# Altium schematic sheet Node_lora_schemetic (1).SchDoc
size 594 x 420 mm; SheetNumber: 1; SheetTotal: 1
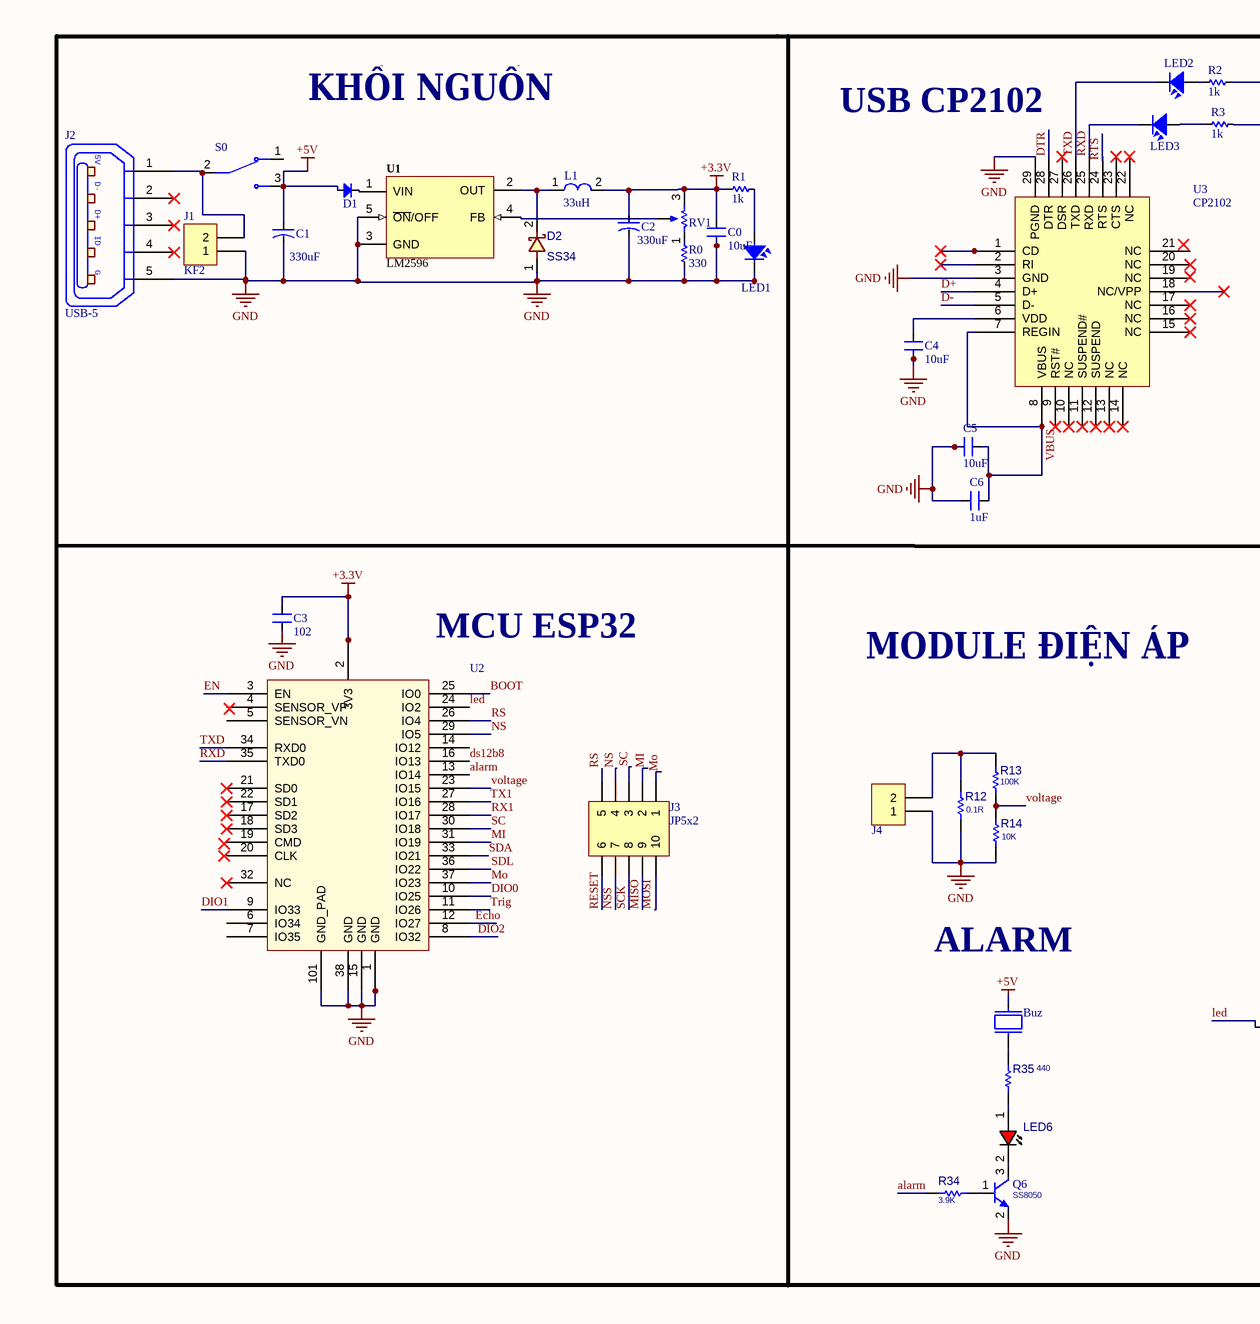
[diagram p0: Node_lora_schemetic (1).SchDoc, left]
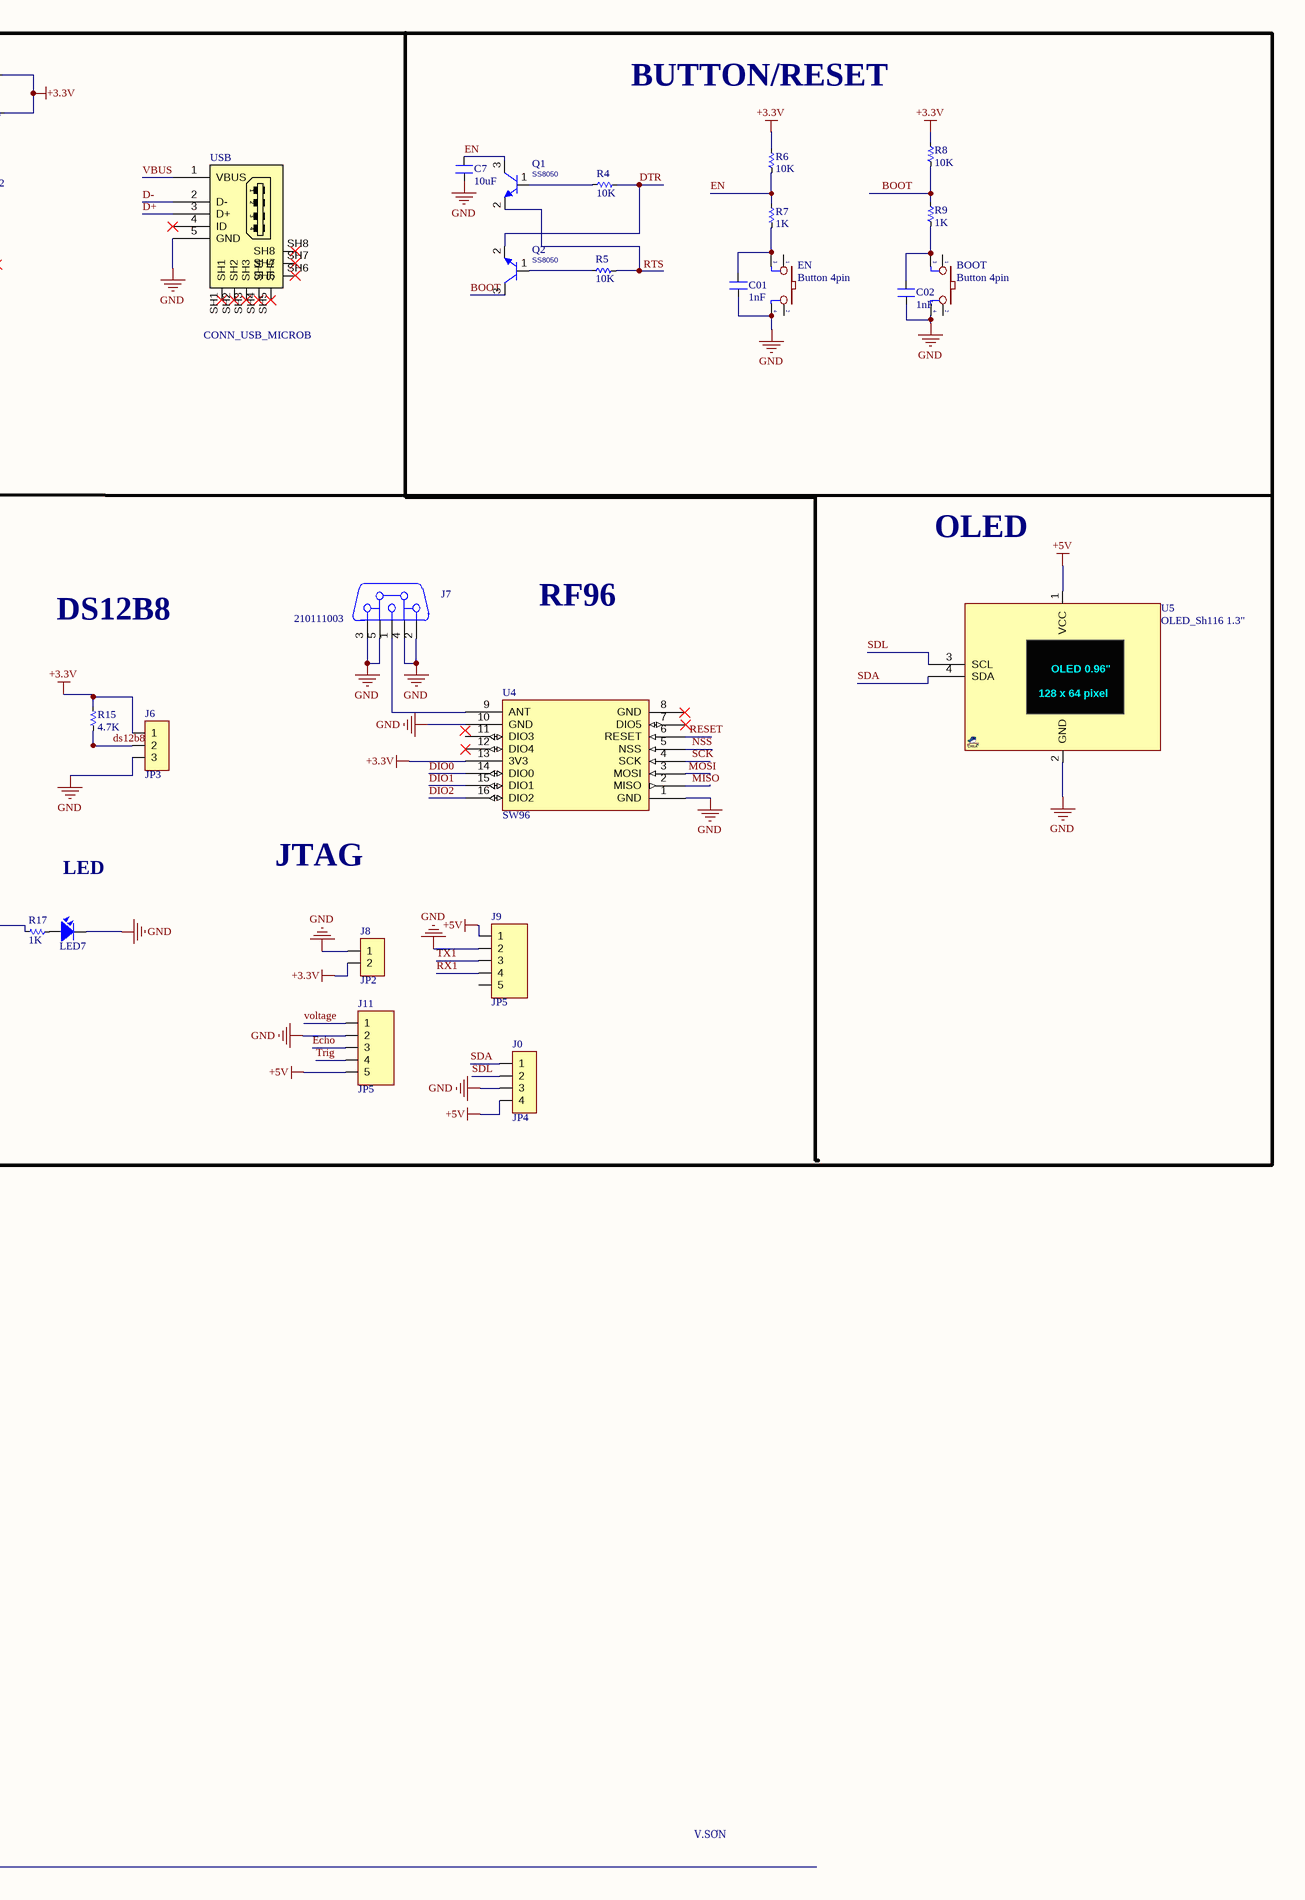
[diagram p1: Node_lora_schemetic (1).SchDoc, right]

## Parts
BOOT  Button 4pin  [Button 4pin]
Buz  PS1240P02BT  [XDCR_PS1240P02BT]  (value not drawn)
C0  10uF  [SM-0805]
C1  330uF  [CAP-ALU-SMD-G]
C01  1nF  [SM-0805]
C2  330uF  [CAP-ALU-SMD-G]
C02  1nF  [SM-0805]
C3  102  [SM-0805]
C4  10uF  [SM-0805]
C5  10uF  [SM-0805]
C6  1uF  [SM-0805]
C7  10uF  [SM-0805]
D1  Diode SMD  [DIO-SMD-106]  (value not drawn)
D2  SS34  [D_SMA]
EN  Button 4pin  [Button 4pin]
J0  JP4  [JP4-C1T]
J1  KF2  [KF2-3.5]
J2  USB-5  [USB-M1]
J3  JP5x2  [JP5-D2T]
J4  KF2  [KF2-3.5]  (value not drawn)
J6  JP3  [JP3-C1T]
J7  210111003  [SMA-RA]
J8  JP2  [JP2-C1T]
J9  JP5  [JP5-C1T]
J11  JP5  [JP5-C1T]
L1  33uH  [L-SMD-M-12x10]
LED1  LED  [LED-0805-Red]  (value not drawn)
LED2  LED  [LED-0805-Red]  (value not drawn)
LED3  LED  [LED-0805-Red]  (value not drawn)
LED6  LED5MM_RED  [LED5MM_RED]  (value not drawn)
LED7  LED  [LED-0805-Red]  (value not drawn)
Q1  SS8050  [SOT23_3]
Q2  SS8050  [SOT23_3]
Q6  SS8050  [SOT23_3]
R0  330  [RES-SMD-0805]
R1  1k  [RES-SMD-0805]
R2  1k  [RES-SMD-0805]
R3  1k  [RES-SMD-0805]
R4  10K  [RES-SMD-0805]
R5  10K  [RES-SMD-0805]
R6  10K  [RES-SMD-0805]
R7  1K  [RES-SMD-0805]
R8  10K  [RES-SMD-0805]
R9  1K  [RES-SMD-0805]
R12  0.1R  [RES-SMD-1206]
R13  100K  [R0805]
R14  10K  [R0805]
R15  4.7K  [RES-SMD-0805]
R17  1K  [RES-SMD-0805]
R34  3.9K  [R0805]
R35  440  [R0805]
RV1  RV20K  [RVAR10K]  (value not drawn)
S0  500SSP1S2M2QEA  [SW_500SSP1S2M2QEA]  (value not drawn)
U1  LM2596  [TO263]
U2  ESP32S_Module  [ESP32S]  (value not drawn)
U3  CP2102  [QFN50P500X500X100-29N]
U4  SW96  [RFM22_S]
U5  OLED_Sh116 1.3"  [OLED_SSD1306_64_I2C]
USB  CONN_USB_MICROB  [USB_MICRO_B_BM_SHS]

## Nets
+3.3V: C0.1 C2.1 C3.1 J6.1 J8.2 L1.2 R1.2 R2.1 R3.1 R6.1 R8.1 R15.1 RV1.3 U2.2(3V3) U4.13(3V3)
+5V: Buz.1 C1.1 D1.1(A) J0.4 J9.1 J11.5 S0.3(NO) U5.1(VCC)
GND: BOOT.4 C0.2 C01.1 C1.2 C02.1 C2.2 C3.2 C4.1 C5.1 C6.2 C7.1 D2.1 EN.4 J0.3 J1.1 J2.5(P5) J4.1 J6.3 J7.2 J7.3 J7.4 J7.5 J8.1 J9.2 J11.2 LED1.2 LED7.2 Q6.2(E) R0.2 R12.2 R14.2 U1.3(GND) U1.5(~{ON}/OFF) U2.1(GND) U2.15(GND) U2.38(GND) U2.101(GND_PAD) U3.3(GND) U3.29(PGND) U4.1(GND) U4.10(GND) U5.2(GND) USB.5(GND)
alarm: R34.2 U2.13(IO14)
BOOT: Q2.3(C) R8.2 R9.1 U2.25(IO0)
D+: U3.4(D+) USB.3(D+)
D-: U3.5(D-) USB.2(D-)
DIO0: U2.10(IO25) U4.14(DIO0)
DIO1: U2.9(IO33) U4.15(DIO1)
DIO2: U2.8(IO32) U4.16(DIO2)
ds12b8: J6.2 R15.2 U2.16(IO13)
DTR: Q2.2(E) R4.1 U3.28(DTR)
Echo: J11.3 U2.12(IO27)
EN: C7.2 Q1.3(C) R6.2 R7.1 U2.3(EN)
led: R17.1 U2.24(IO2)
MI: J3.2 U2.31(IO19)
MISO: J3.9 U4.2(MISO)
Mo: J3.1 U2.37(IO23)
MOSI: J3.10 U4.3(MOSI)
NS: J3.4 U2.29(IO5)
NSS: J3.7 U4.5(NSS)
RESET: J3.6 U4.6(RESET)
RS: J3.5 U2.26(IO4)
RTS: U3.24(RTS)
RX1: J9.4 U2.28(IO17)
RXD: LED3.2 U2.35(TXD0) U3.25(RXD)
SC: J3.3 U2.30(IO18)
SCK: J3.8 U4.4(SCK)
SDA: J0.1 U2.33(IO21) U5.4(SDA)
SDL: J0.2 U2.36(IO22) U5.3(SCL)
Trig: J11.4 U2.11(IO26)
TX1: J9.3 U2.27(IO16)
TXD: LED2.2 U2.34(RXD0) U3.26(TXD)
VBUS: C5.2 C6.1 U3.7(REGIN) U3.8(VBUS) USB.1(VBUS)
voltage: J11.1 R13.1 R14.1 U2.23(IO15)
NetBOOT_3: BOOT.3 C02.2 R9.2
NetBuz_2: Buz.2 R35.1
NetC01_2: C01.2 EN.3 R7.2
NetC4_2: C4.2 U3.6(VDD)
NetD1_2: D1.2(K) U1.1(VIN)
NetD2_2: D2.2 L1.1 RV1.2 U1.2(OUT) U1.4(FB)
NetJ1_2: J1.2 J2.1(P1) S0.2(COM)
NetJ4_2: J4.2 R12.1 R13.2
NetJ7_1: J7.1 U4.9(ANT)
NetLED1_1: LED1.1 R1.1
NetLED2_1: LED2.1 R2.2
NetLED3_1: LED3.1 R3.2
NetLED6_1: LED6.1(ANODE) R35.2
NetLED6_2: LED6.2(CATHODE) Q6.3(C)
NetLED7_1: LED7.1 R17.2
NetQ1_1: Q1.1(B) R4.2
NetQ1_2: Q1.2(E) R5.1
NetQ2_1: Q2.1(B) R5.2
NetQ6_1: Q6.1(B) R34.1
NetR0_1: R0.1 RV1.1

Not connected (* = marked no-connect by the designer): BOOT 1 2; EN 1 2; J2 2(P2)* 3(P3)* 4(P4)*; J9 5; S0 1(NC); U2 4(SENSOR_VP) 5(SENSOR_VN) 6(IO34) 7(IO35) 14(IO12) 17(SD2)* 18(SD3)* 19(CMD) 20(CLK) 21(SD0)* 22(SD1)* 32(NC)*; U3 1(CD)* 2(RI)* 9(RST#)* 10(NC)* 11(SUSPEND#)* 12(SUSPEND)* 13(NC)* 14(NC)* 15(NC)* 16(NC)* 17(NC)* 18(NC/VPP)* 19(NC) 20(NC)* 21(NC) 22(NC)* 23(CTS)* 27(DSR)*; U4 7(DIO5)* 8(GND) 11(DIO3) 12(DIO4)*; USB 4(ID)* SH1* SH2* SH3* SH4* SH5* SH6* SH7* SH8*

## Notes on the sheet
- KHỐI NGUỒN
- USB CP2102
- BUTTON/RESET
- OLED
- (near U2) MCU ESP32
- MODULE ĐIỆN ÁP
- DS12B8
- RF96
- ALARM
- LED
- JTAG
- V.SƠN
- Labels drawn without touching a wire or pin: \, RTS
- DWG NO:
- REV:
- THIS DOCUMENT AND THE DATA DISCLOSED HEREIN OR
- HEREWITH IS THE PROPERTY OF ALTIUM LIMITED AND MAY
- BE FREELY DISTRIBUTED IN WHOLE. NO RIGHTS ARE
- RESERVED OR EXPRESS OR IMPLIED WARANTEE GIVEN.
- REVISION
- DESCRIPTION
- DATE
- APPROVED
- ENG:
- APPROVALS
- PROJECT
- DSN:
- CHK:
- REFERENCE DOCUMENTS
- PROJECT REVISION:
- TITLE
- DOCUMENT REVISION:
- DESIGN ITEM:
- BOM:
- FAB DWG:
- PCB DWG:
- ASSY DWG:
- SCALE:
- A2
- SIZE
- CAGE CODE
- FILE NAME
- DWG NO.
- SHEET
- OF
- REV
- (in symbol OLED_SSD1306_64_I2C) OLED 0.96"; 128 x 64 pixel
- (in symbol USB-5) 5V; D-; D+; ID; G

## Library data of the parts
Buz = PS1240P02BT: Buzzers Transducer, Externally Driven Piezo 3V 4kHz 60dB @ 3V, 10cm Through Hole PC Pins; MF: TDK; MP: PS1240P02BT; Availability: Unavailable; Package: 2020 TDK; Value: *; Price: None; SnapEDA_Link: https://www.snapeda.com/parts/PS1240P02BT/TDK/view-part/53420/?ref=snap
C0 C01 C02-C7 = CM: Cap SMD; Value: 103
C1 C2 = CN-ALU-SMD: Polarized Capacitor (Axial); Published: 8-Jun-2000; LatestRevisionDate: 17-Jul-2002; LatestRevisionNote: Re-released for DXP Platform.; PackageReference: POLAR0.8; Publisher: Altium Limited
D1 = Diode SMD: Default Diode; Code - JEDEC: DO-214-AB; Value: 1N5007; Published: 8-Jun-2000; Revision: July-2002: Re-released for DXP Platform.; Publisher: Altium Limited
D2 = DIODE_SMD_SCHOTTKY_1N5822: DIODE, SCHOTTKY, 40V, 3A; MANF: DIODES; MANF_P#: 1N5822; DESC: DESCRIPTION; ASSEMBLY: ASSEMBLY; PRICE: PRICE; PARAM2: 3A; PARAM: 40V; VALUE: SS34
J0 = JP4: WR-PHD 2.54 mm Angled Socket Header; Manufacturer: W¨¹rth Elektronik eiSos GmbH; partNo: 613004143121; ComponentLink1 Description: Manufacturer; ComponentLink2 Description: Datasheet; NoPins: 04; Created Date: 29 March 2013; ComponentLink1URL: http://www.we-online.com; ComponentLink2URL: http://katalog.we-online.de/em/datasheet/6130xx143121.pdf; Created by: Karrer Zheng
J1 J4 = KF2: Manufacturer: Würth Elektronik eiSos GmbH; partNo: 691103110002; ComponentLink1 Description: Manufacturer; ComponentLink2 Description: Datasheet; NoPins: 2; Created Date: 29 October 2013; ComponentLink1URL: http://www.we-online.com; ComponentLink2URL: http://katalog.we-online.de/em/datasheet/6911031100xx.pdf; Created by: Karrer Zheng
J2 = USB-5: Manufacturer: FCI; Manufacturer Part Number: 10118193-0001LF; Connector Type: USB - micro B; Number of Contacts: 5; Gender: Receptacle; Specifications: USB 2.0; .Creator: MM; .Checked PCB: RF; Supplier 1: Digi-Key; RoHS: RoHS Compliant; Category: Connectors, Interconnects; Stock 1: 28642; Pricing 1: 1=0.46, 10=0.433, 25=0.3712, 50=0.3156, 100=0.3032, 250=0.27224, 500=0.25988 (USD); Packaging: Cut Tape (CT); Mounting Type: Surface Mount, Right Angle, Horizontal; Features: Shielded, Solder Retention; Ingress Protection: -; ComponentLink1URL: http://portal.fciconnect.com/Comergent//fci/drawing/10118193.pdf; ComponentLink1Description: http://portal.fciconnect.com/Comergent//fci/drawing/10118193.pdf; Supplier Part Number 1: 609-4616-1-ND; .Checked SCH: MM
J3 = JP5x2: WR-PHD 2.54 mm Dual Socket Header; Manufacturer: W¨¹rth Elektronik eiSos GmbH; partNo: 61301021821; ComponentLink1 Description: Manufacturer; ComponentLink2 Description: Datasheet; NoPins: 10; Created Date: 29 March 2013; ComponentLink1URL: http://www.we-online.com; ComponentLink2URL: http://katalog.we-online.de/em/datasheet/6130xx21821.pdf; Created by: Karrer Zheng
J6 = JP3: WR-PHD 2.54 mm Angled Socket Header; Manufacturer: W¨¹rth Elektronik eiSos GmbH; partNo: 613003143121; ComponentLink1 Description: Manufacturer; ComponentLink2 Description: Datasheet; NoPins: 03; Created Date: 29 March 2013; ComponentLink1URL: http://www.we-online.com; ComponentLink2URL: http://katalog.we-online.de/em/datasheet/6130xx143121.pdf; Created by: Karrer Zheng
J7 = CON Ant: CONNECTOR ANTEN; Manufacturer: Würth Elektronik eiSos GmbH; partNo: 210111003; ComponentLink1Description: Manufacturer; ComponentLink1URL: http://www.we-online.de; Created by: Christin Zierenner; Created Date: May 2012; ComponentLink2Description: Datasheet; ComponentLink2URL: http://katalog.we-online.de/kataloge/eisos/index.php?language=en&pf=Filter_gerade
J8 = JP2: WR-PHD 2.54 mm Angled Socket Header; Manufacturer: W¨¹rth Elektronik eiSos GmbH; partNo: 613002143121; ComponentLink1 Description: Manufacturer; ComponentLink2 Description: Datasheet; NoPins: 02; Created Date: 29 March 2013; ComponentLink1URL: http://www.we-online.com; ComponentLink2URL: http://katalog.we-online.de/em/datasheet/6130xx143121.pdf; Created by: Karrer Zheng
J9 J11 = JP5: WR-PHD 2.54 mm Angled Socket Header; Manufacturer: W¨¹rth Elektronik eiSos GmbH; partNo: 613005143121; ComponentLink1 Description: Manufacturer; ComponentLink2 Description: Datasheet; NoPins: 05; Created Date: 29 March 2013; ComponentLink1URL: http://www.we-online.com; ComponentLink2URL: http://katalog.we-online.de/em/datasheet/6130xx143121.pdf; Created by: Karrer Zheng
L1 = L-SMD-1: partNo: 78477010; Manufacturer: Wurth Elektronik; Inductance: 1.0 μH; ComponentLink1Description: Manufacturer; ComponentLink1URL: http://www.we-online.de; Created by: Baojun Chen; Created Date: Nov.2015; ComponentLink2Description: Datasheet; ComponentLink2URL: http://katalog.we-online.de/pbs/datasheet/78477010.pdf
LED1-LED3 LED7 = LED SMD: Value: LED 3 - 5 ly 2 Colour
LED6 = LED_THD_5MM_RED: LED, THD, 5MM, RED; DESC: DESCRIPTION; MANF_P#: MANF_PART#; PARAM2: 2.2V; MANF: MANF; ASSEMBLY: ASSEMBLY; PRICE: PRICE; VALUE: LED5MM_RED
Q1 Q2 Q6 = NPN_MMBT8050_SOT23: BJT, NPN, 25v, 1.5A, SMD, SOT23; PARAM2: 300mW; MANF: GALAXY; PARAM: 25v, 1.5A; MANF_P#: MMBT8050; PRICE: 0.09t@JAVAN; VALUE: SS8050
R0-R9 R15 R17 = Res-SMD: Resistor; Manufacturer: Generic Components; Class: Passive; Published: 08/06/2000; Publisher: Altium Hobart Technology Centre
R12-R14 R34 R35 = RES_SMD_0805: RESISTOR, SMD; PARAM: 0.125W; DESC: DESCRIPTION; DIST#: MOUSER; PARAM2: 1%; MANF_P#: -; MANF: -; ASSEMBLY: ASSEMBLY; PRICE: 100= 0.5$
  R12: VALUE: 0.1R
  R13: VALUE: 100K
  R14: VALUE: 10K
  R34: VALUE: 3.9K
  R35: VALUE: 440
RV1 = Variable Resistor: Sim Note: Enter the Resistance value and the set point into parameter fields.; Set Position: 0.5; Published: 8-Jun-2000; LatestRevisionDate: 17-Jul-2002; LatestRevisionNote: Re-released for DXP Platform.; PackageReference: VR5; Publisher: Altium Limited
S0 = 500SSP1S2M2QEA: Slide Switch SPDT Through Hole; Package: None; Availability: Unavailable; Value: *; MP: 500SSP1S2M2QEA; Price: None
U1 = LM2596: Max Input Voltage: 12 V; Max Output Current: 3 (6.0 peak) A; Max Output Voltage: mV; Category: IC-Power; Min Input Voltage: mV; Min Output Voltage: mV; Mounting Technology: Surface Mount; Status: Unreleased; Supply Voltage: mV; Temperature Range: -40 to +125 degC
U2 = ESP32S_Module: Esp-32S; Datasheet: https://espressif.com/sites/default/files/documentation/esp_wroom_32_datasheet_en.pdf
U3 = CP2102: USB to USRT converter
U5 = OLED_SSD1306_64_I2C: OLED, SSD1306, 0.96", 128X64, BREAKOUT I2C; MANF_P#: OLED_SSD1306_I2C; PARAM2: 3.3/5VCC, -20~70oC; PARAM: 2 Colors, 0.96", 128X64; MANF: -; VALUE: OLED_Sh116 1.3"
USB = CONN_USB_MICRO_B_BM_SHS: CONN, USB, MICRO B, R/A, SMD, BOTTOM MOUNT; MANF_P#: 47346-0001; MANF: Molex; MANF_P#2: HIROSE ZX62-AB-5PA; PARAM2: 30VAC; PARAM: 1.8A, -20~85oC; PRICE: 0.75$; VALUE: CONN_USB_MICROB